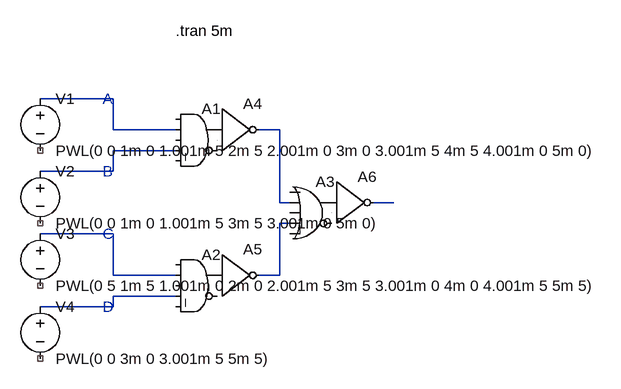
[diagram p0: schematic 46.asc]
46.asc, the LTspice schematic file:
Version 4.1
SHEET 1 880 832
WIRE 32 64 -80 64
WIRE 32 112 32 64
WIRE 128 112 32 112
WIRE 288 112 256 112
WIRE 128 144 32 144
WIRE 32 176 32 144
WIRE 32 176 -80 176
WIRE 288 224 288 112
WIRE 304 224 288 224
WIRE 464 224 432 224
WIRE 304 256 288 256
WIRE 32 272 -80 272
WIRE 32 336 32 272
WIRE 128 336 32 336
WIRE 288 336 288 256
WIRE 288 336 256 336
WIRE 128 368 32 368
WIRE 32 384 32 368
WIRE 32 384 -80 384
SYMBOL voltage -80 48 R0
WINDOW 123 0 0 Left 0
WINDOW 39 0 0 Left 0
SYMATTR InstName V1
SYMATTR Value PWL(0 0 1m 0 1.001m 5 2m 5 2.001m 0 3m 0 3.001m 5 4m 5 4.001m 0 5m 0)
SYMBOL voltage -80 160 R0
WINDOW 123 0 0 Left 0
WINDOW 39 0 0 Left 0
SYMATTR InstName V2
SYMATTR Value PWL(0 0 1m 0 1.001m 5 3m 5 3.001m 0 5m 0)
SYMBOL voltage -80 256 R0
WINDOW 123 0 0 Left 0
WINDOW 39 0 0 Left 0
SYMATTR InstName V3
SYMATTR Value PWL(0 5 1m 5 1.001m 0 2m 0 2.001m 5 3m 5 3.001m 0 4m 0 4.001m 5 5m 5)
SYMBOL voltage -80 368 R0
WINDOW 123 0 0 Left 0
WINDOW 39 0 0 Left 0
SYMATTR InstName V4
SYMATTR Value PWL(0 0 3m 0 3.001m 5 5m 5)
SYMBOL Digital\\and 160 64 R0
SYMATTR InstName A1
SYMBOL Digital\\and 160 288 R0
SYMATTR InstName A2
SYMBOL Digital\\or 336 176 R0
SYMATTR InstName A3
SYMBOL Digital\\inv 192 48 R0
SYMATTR InstName A4
SYMBOL Digital\\inv 192 272 R0
SYMATTR InstName A5
SYMBOL Digital\\inv 368 160 R0
SYMATTR InstName A6
TEXT 16 64 Left 2 ;A
TEXT 16 176 Left 2 ;B
TEXT 16 272 Left 2 ;C
TEXT 16 384 Left 2 ;D
TEXT 128 -40 Left 2 !.tran 5m

The netlist it stands for:
* 46.asc
V1 N001 NC_01 PWL(0 0 1m 0 1.001m 5 2m 5 2.001m 0 3m 0 3.001m 5 4m 5 4.001m 0 5m 0)
V2 N003 NC_02 PWL(0 0 1m 0 1.001m 5 3m 5 3.001m 0 5m 0)
V3 N006 NC_03 PWL(0 5 1m 5 1.001m 0 2m 0 2.001m 5 3m 5 3.001m 0 4m 0 4.001m 5 5m 5)
V4 N007 NC_04 PWL(0 0 3m 0 3.001m 5 5m 5)
A1 0 N001 0 N003 0 0 P001 0 AND
A2 0 N006 0 N007 0 0 P002 0 AND
A3 0 N002 0 N005 0 0 P003 0 OR
A4 P001 0 0 0 0 N002 0 0 BUF
A5 P002 0 0 0 0 N005 0 0 BUF
A6 P003 0 0 0 0 N004 0 0 BUF
* A
* B
* C
* D
.tran 5m
.backanno
.end